# Altium schematic sheet FOC_driver.SchDoc
size A4; SheetNumber: 4; SheetTotal: 5
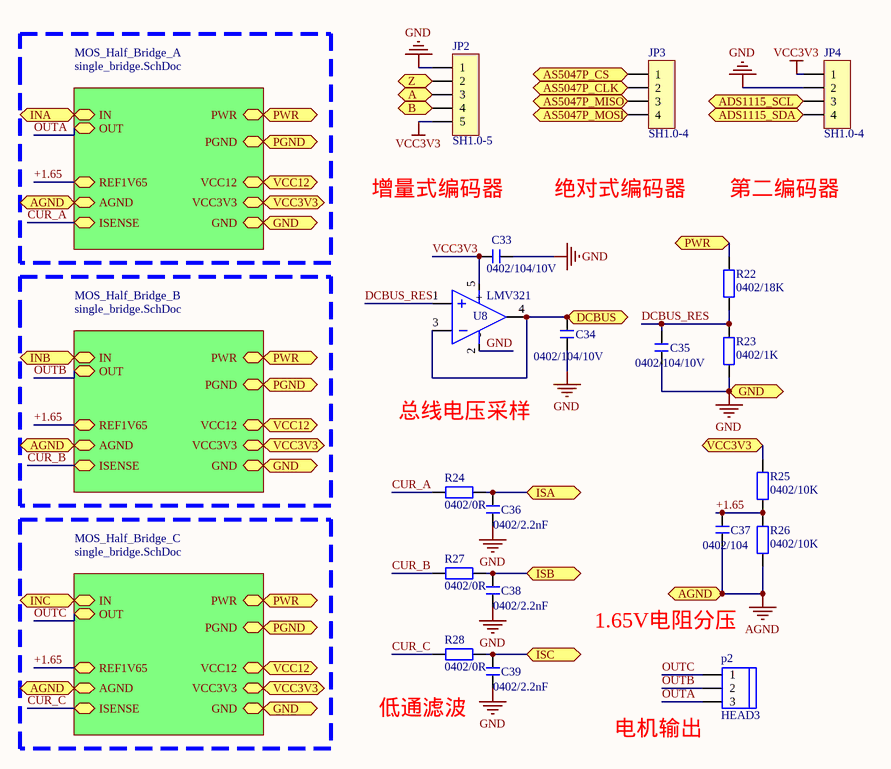
[diagram p0: FOC_driver.SchDoc]

## Parts
C33  0402/104/10V  [0402C]
C34  0402/104/10V  [0402C]
C35  0402/104/10V  [0402C]
C36  0402/2.2nF  [0402C]
C37  0402/104  [0402C]
C38  0402/2.2nF  [0402C]
C39  0402/2.2nF  [0402C]
JP2  SH1.0-5  [SH1.0-5P-P1.00]
JP3  SH1.0-4  [SH1.0-P1.00_-4P]
JP4  SH1.0-4  [SH1.0-P1.00_-4P]
p2  HEAD3  [KF301-5.0-3P]
R22  0402/18K  [0402R]
R23  0402/1K  [0402R]
R24  0402/0R  [0402R]
R25  0402/10K  [0402R]
R26  0402/10K  [0402R]
R27  0402/0R  [0402R]
R28  0402/0R  [0402R]
U8  LMV321  [SOT-23-5]

## Sub-sheets
MOS_Half_Bridge_A = single_bridge.SchDoc: IN (bidir), PWR (bidir), GND (bidir), ISENSE (bidir), VCC3V3 (bidir), PGND (bidir), VCC12 (bidir), REF1V65 (bidir), AGND (bidir), OUT (bidir)
MOS_Half_Bridge_B = single_bridge.SchDoc: IN (bidir), PWR (bidir), GND (bidir), ISENSE (bidir), VCC3V3 (bidir), PGND (bidir), VCC12 (bidir), REF1V65 (bidir), AGND (bidir), OUT (bidir)
MOS_Half_Bridge_C = single_bridge.SchDoc: IN (bidir), PWR (bidir), GND (bidir), ISENSE (bidir), VCC3V3 (bidir), PGND (bidir), VCC12 (bidir), REF1V65 (bidir), AGND (bidir), OUT (bidir)

## Ports
A (bidir), ADS1115_SCL (bidir), ADS1115_SDA (bidir), AGND (bidir), AS5047P_CLK (bidir), AS5047P_CS (bidir), AS5047P_MISO (bidir), AS5047P_MOSI (bidir), B (bidir), DCBUS (bidir), GND (bidir), INA (bidir), INB (bidir), INC (bidir), ISA (bidir), ISB (bidir), ISC (bidir), PGND (bidir), PWR (bidir), VCC3V3 (bidir), VCC12 (bidir), Z (bidir)

## Nets
AGND: C37.2 R26.2 ; port AGND, sheet MOS_Half_Bridge_A/AGND, sheet MOS_Half_Bridge_B/AGND, sheet MOS_Half_Bridge_C/AGND
GND: C33.1 C34.2 C35.1 C36.1 C38.1 C39.1 JP2.1 JP4.2 R23.1 U8.2(-) ; port GND, sheet MOS_Half_Bridge_A/GND, sheet MOS_Half_Bridge_B/GND, sheet MOS_Half_Bridge_C/GND
VCC3V3: C33.2 JP2.5 JP4.1 U8.5(+)
+1.65: C37.1 R25.2 R26.1 ; sheet MOS_Half_Bridge_A/REF1V65, sheet MOS_Half_Bridge_B/REF1V65, sheet MOS_Half_Bridge_C/REF1V65
A: JP2.3 ; port A
ADS1115_SCL: JP4.3 ; port ADS1115_SCL
ADS1115_SDA: JP4.4 ; port ADS1115_SDA
AS5047P_CLK: JP3.2 ; port AS5047P_CLK
AS5047P_CS: JP3.1 ; port AS5047P_CS
AS5047P_MISO: JP3.3 ; port AS5047P_MISO
AS5047P_MOSI: JP3.4 ; port AS5047P_MOSI
B: JP2.4 ; port B
CUR_A: R24.2 ; sheet MOS_Half_Bridge_A/ISENSE
CUR_B: R27.2 ; sheet MOS_Half_Bridge_B/ISENSE
CUR_C: R28.2 ; sheet MOS_Half_Bridge_C/ISENSE
DCBUS: C34.1 U8.3(IN-) U8.4(OUT) ; port DCBUS
DCBUS_RES: C35.2 R22.1 R23.2 U8.1(IN+)
INA: port INA, sheet MOS_Half_Bridge_A/IN
INB: port INB, sheet MOS_Half_Bridge_B/IN
INC: port INC, sheet MOS_Half_Bridge_C/IN
ISA: C36.2 R24.1 ; port ISA
ISB: C38.2 R27.1 ; port ISB
ISC: C39.2 R28.1 ; port ISC
OUTA: p2.3 ; sheet MOS_Half_Bridge_A/OUT
OUTB: p2.2 ; sheet MOS_Half_Bridge_B/OUT
OUTC: p2.1 ; sheet MOS_Half_Bridge_C/OUT
PGND: port PGND, sheet MOS_Half_Bridge_A/PGND, sheet MOS_Half_Bridge_B/PGND, sheet MOS_Half_Bridge_C/PGND
PWR: R22.2 ; port PWR, sheet MOS_Half_Bridge_A/PWR, sheet MOS_Half_Bridge_B/PWR, sheet MOS_Half_Bridge_C/PWR
VCC3V3: R25.1 ; port VCC3V3, sheet MOS_Half_Bridge_A/VCC3V3, sheet MOS_Half_Bridge_B/VCC3V3, sheet MOS_Half_Bridge_C/VCC3V3  [a separate net that carries the same name]
VCC12: port VCC12, sheet MOS_Half_Bridge_A/VCC12, sheet MOS_Half_Bridge_B/VCC12, sheet MOS_Half_Bridge_C/VCC12
Z: JP2.2 ; port Z

## Notes on the sheet
- 增量式编码器
- 绝对式编码器
- 第二编码器
- 总线电压采样
- (near p2) 1.65V电阻分压
- 低通滤波
- 电机输出

## Library data of the parts
C33-C35 = C: 贴片电容; value: 104/10V; 嘉立创元件编号: C110251
C36 C38 C39 = C: 贴片电容; value: 2.2nF; 嘉立创元件编号: C2987940
C37 = C: 贴片电容; value: 104; 嘉立创元件编号: C110251
JP2 = 5p_G: 5针排针; BOM名称: 4P接插件; 版权归属: 源创客; 学习资源: www.ooocke.com; 嘉立创元件编号: C3029344
JP3 JP4 = 4p_G: 4针排针; BOM名称: 4P接插件; 版权归属: 源创客; 学习资源: www.ooocke.com; 嘉立创元件编号: C7430446
p2 = HEAD3: 接线端子3P; 嘉立创元件编号: C474882
R22 = R: 贴片电阻; value: 18K; 嘉立创元件编号: C138044
R23 = R: 贴片电阻; value: 1K; 嘉立创元件编号: C11702
R24 R27 R28 = R: 贴片电阻; value: 0R; 嘉立创元件编号: C17168
R25 R26 = R: 贴片电阻; value: 10K; 嘉立创元件编号: C25744
U8 = LMV321: 运放; 嘉立创元件编号: C7972